# EAGLE design lab-genelec8010-input-board-v10 (EAGLE 9.6.2)
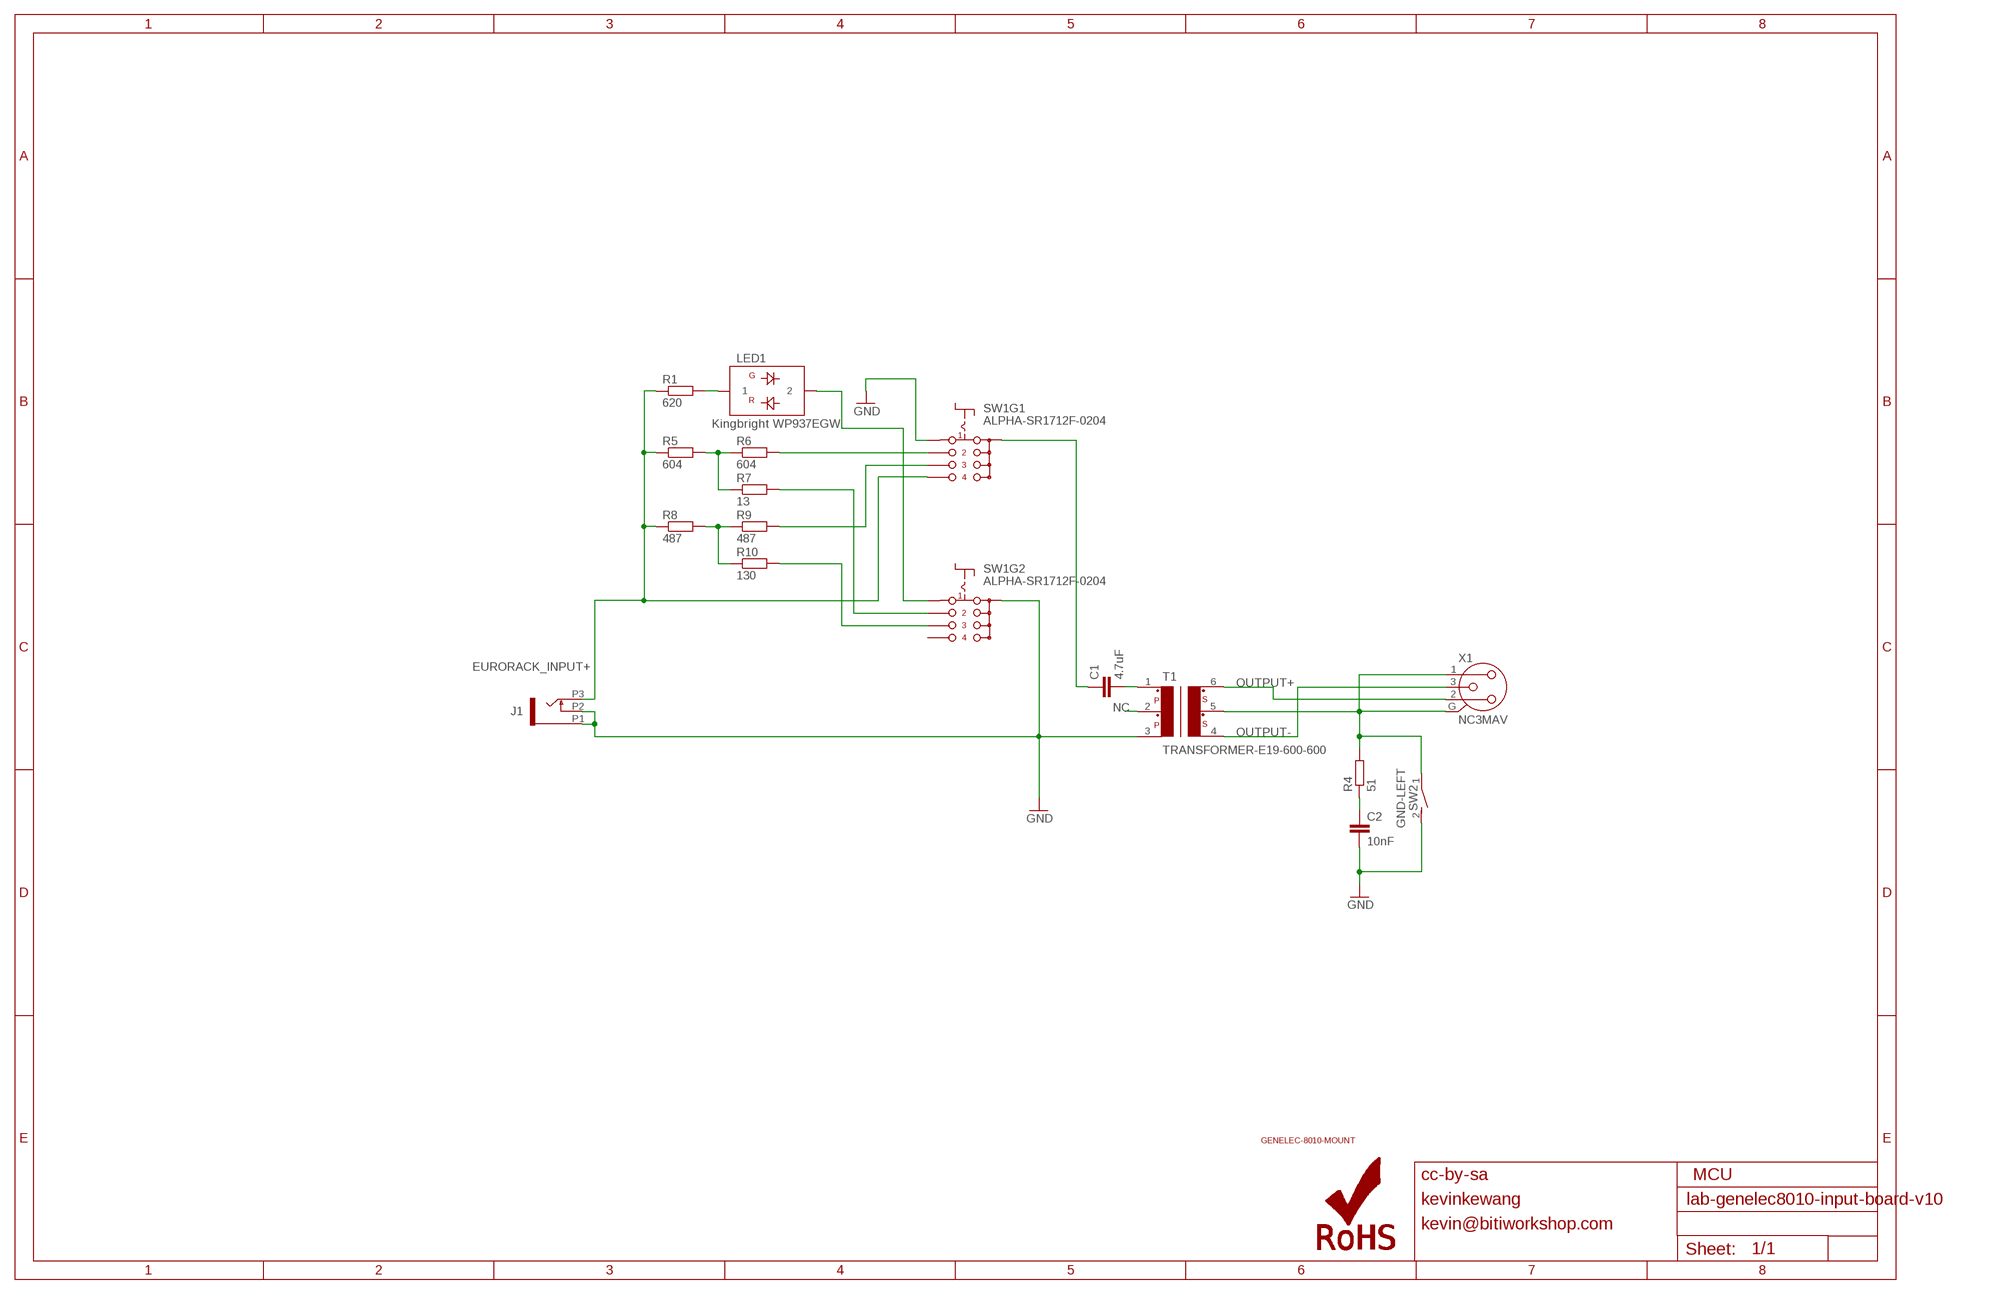
[diagram p0: schematic, sheet 1]

## Parts
C1  4.7uF  C15/5  [C15B5]
C2  10nF  C-EU025-025X050  [C025-025X050]
J1  OG-PJ301_PJ301_THONKICONN6  [OG-PJ301_WQP_PJ_301M6]
LED1  Kingbright WP937EGW  OG-LEDS_LED-BICOLOR-SHARED-THROUGHHOLE  [OG-LEDS_LED3MM]
LOGO2  ROHS_LOGO  [ROHS_LOGO_0.18_IN]
R1  620  R-EU_0204/2V  [0204V]
R4  51  R-EU_0204/2V  [0204V]
R5  604  R-EU_0204/2V  [0204V]
R6  604  R-EU_0204/2V  [0204V]
R7  13  R-EU_0204/2V  [0204V]
R8  487  R-EU_0204/2V  [0204V]
R9  487  R-EU_0204/2V  [0204V]
R10  130  R-EU_0204/2V  [0204V]
SW1  ALPHA-SR1712F-0204  [ALPHA-SR1712F-0204]
SW2  GND-LEFT  DS01E  [DS-01]
T1  TRANSFORMER-E19-600-600  [TRANSFORMER-E19-600-600]
U$2  GENELEC-8010-MOUNT  [GENELEC-8010-MOUNT]
X1  NC3MAV  [NC3MAV]

## Nets
EURORACK_INPUT+: J1.P3 R1.1 R5.1 R8.1 SW1.5
GND: C2.2 J1.P1 J1.P2 SW1.2 SW1.COM10(C) SW2.2 T1.3
N$1: LED1.2 SW1.6
N$2: LED1.1 R1.2
N$3: C1.2 T1.1
N$5: R5.2 R6.1 R7.1
N$6: C2.1 R4.1
N$7: R4.2 SW2.1 T1.5 X1.1 X1.G
N$9: R6.2 SW1.3
N$10: R7.2 SW1.7
N$11: R8.2 R9.1 R10.1
N$13: R9.2 SW1.4
N$14: R10.2 SW1.8
N$16: C1.1 SW1.COM1(C)
NC: T1.2
OUTPUT+: T1.6 X1.2
OUTPUT-: T1.4 X1.3
Unconnected: SW1.9

## Notes on the sheet
- cc-by-sa | MCU
- kevinkewang
- kevin@bitiworkshop.com

## Library data of the parts
C1 = capacitor-wima:C: CAPACITOR naming: grid - package width
C2 = rcl:C-EU: CAPACITOR, European symbol; SPICEPREFIX: C
J1 = tides2_v40:OG-PJ301_PJ301_THONKICONN
LED1 = tides2_v40:OG-LEDS_LED-BICOLOR-SHARED-THROUGHHOLE
LOGO2 = SparkFun-Aesthetics:ROHS_LOGO: Restriction of Hazardous Substances (RoHS) Logo Logo for RoHS-certified hardware.
R1 R4-R10 = rcl:R-EU_: RESISTOR, European symbol; SPICEPREFIX: R
SW1 = biti-switch:ALPHA-SR1712F-0204
SW2 = Switch:DS01E: DIL/CODE Switch; CATEGORY_L1: Switches; CATEGORY_L2: DIP Switches; CATEGORY_L3: SPST-NO; MANUFACTURER: Multicomp Pro; OPERATING_TEMPERATURE: -40°C ~ 85°C; PACKAGE: Through Hole; PACKAGE_SIZE: NA; PART_STATUS: Obsolete; ROHS: Compliant
T1 = biti-transformer:TRANSFORMER-E19-600-600: TRANSFORMER-E19-600-600
U$2 = biti-mount:GENELEC-8010-MOUNT
X1 = con-neutrik_ag:NC3: Neutrik Audio Connector XLR SERIES Stereo 1/4" jack Source: www.neutrik.com/; MF: FARNELL; MPN: NC3MAV; OC_FARNELL: 724531; OC_NEWARK: 46WX3058

## Board
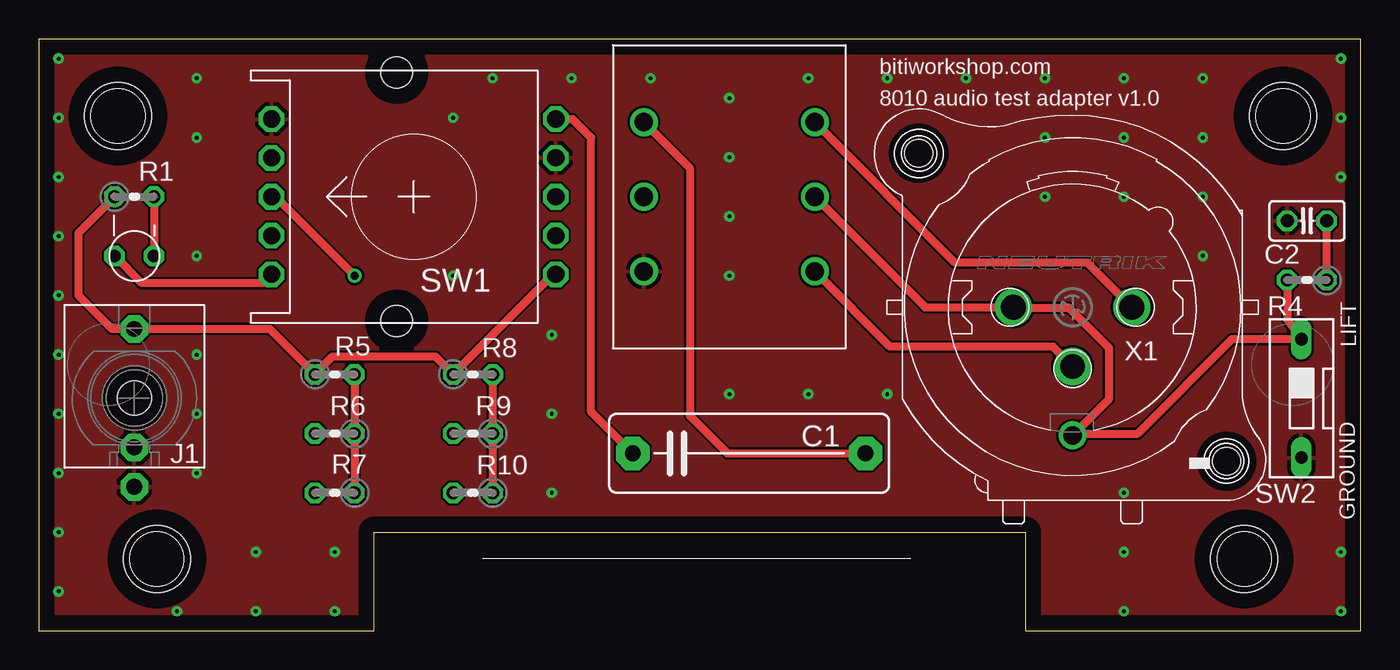
[diagram p1: board, top side]
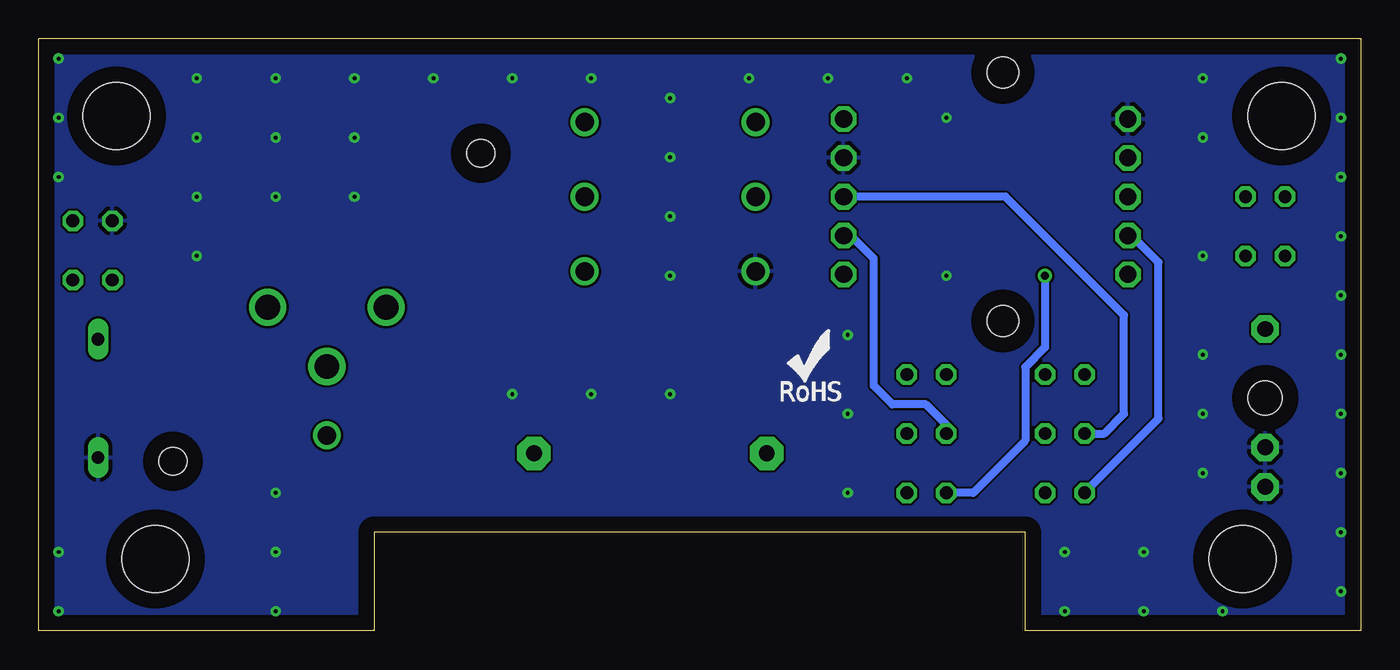
[diagram p2: board, bottom side, seen from below]

Size 85.09 x 38.1 mm. Coordinates in mm from the lower left corner, seen from the top.
Outline: 85.09,0 85.09,38.1 0,38.1 0,0 21.59,0 21.59,6.35 63.5,6.35 63.5,0 85.09,0
Copper layers (1*16): Top 0.035mm / dielectric 1.5mm / Bottom 0.035mm
Design rules "default *": minimum track width 6mil, minimum drill 0.35mm, track to track 6mil, track to pad 6mil, pad to pad 6mil, via to via 6mil, smd to smd 6mil, copper to edge 40mil, drill to drill 6mil, minimum pad ring 10mil, minimum via ring 8mil, stop-mask expansion 4mil, vias tented up to drill 20mil, thermal gap 10mil
Holes 1.78 mm at 56.64,30.73 76.45,10.92

### Footprints (pad centres in the part's own frame; a part is rotated, then mirrored left to right if it is on the bottom)
C15B5 = drill 1.016 pad 2.159 octagon: 1 -7.493,0; 2 7.493,0
C025-025X050 = drill 0.813 octagon: 1 -1.27,0; 2 1.27,0
OG-PJ301_WQP_PJ_301M6 = drill 1.016 pad 1.778 octagon: P1 0,-5.715; P2 0,-3.175; P3 0,4.445 | hole 2.2: 0,0
OG-LEDS_LED3MM = drill 0.813 octagon: 1 -1.27,0; 2 1.27,0
0204V = drill 0.813 octagon: 1 -1.27,0; 2 1.27,0
ALPHA-SR1712F-0204 = drill 1.1 octagon: 2 2.5,-9.15; 3 0,-9.15; 4 -2.5,-9.15; 5 -5,-9.15; 6 -5,9.15; 7 -2.5,9.15; 8 0,9.15; 9 2.5,9.15; COM1 5,-9.15; COM10 5,9.15 | hole 2: 8,1.1; -8,1.1
DS-01 = drill 0.813 long: 1 0,-3.81; 2 0,3.81
TRANSFORMER-E19-600-600 = drill 1.2: 1 4.8,5.5; 2 0,5.5; 3 -4.8,5.5; 4 -4.8,-5.5; 5 0,-5.5; 6 4.8,-5.5
GENELEC-8010-MOUNT = hole 4.3: -36.817,15.354; -34.317,-13.146; 35.683,-13.146; 38.183,15.354
NC3MAV = drill 1.6: 1 -3.81,0; 2 3.81,0; 3 0,-3.81 | drill 1.2: G 0,-8.25

### Placement (x,y rotation side)
C1  45.72,11.43 0 top
C2  81.64,26.39 180 top
J1  6.15,14.99 0 top
LED1  6.15,24.13 180 top
LOGO2  37.54,14.68 0 bottom
R1  6.15,27.94 0 top
R4  81.64,22.58 180 top
R5  19.05,16.51 0 top
R6  19.05,12.7 180 top
R7  19.05,8.89 180 top
R8  27.94,16.51 0 top
R9  27.94,12.7 180 top
R10  27.94,8.89 180 top
SW1  24.13,27.94 90 top
SW2  81.28,14.96 180 top
T1  44.45,27.94 90 top
U$2  41.91,17.78 0 top
X1  66.55,20.83 0 top

### Tracks (layer width: path | path; a pad name or v marks a point on that pad's centre or on a via)
EURORACK_INPUT+
  Top 0.508: R1.1 2.54,25.6 2.54,21.59 4.7,19.43 J1.P3 14.86,19.43 R5.1 17.78,16.55 18.89,17.65 25.53,17.65 R8.1 33.1,22.94 SW1.5
GND  (via drill 0.25)
  other vias: 1.27,36.83 1.27,33.02 1.27,29.21 1.27,25.4 1.27,21.59 1.27,17.78 1.27,13.97 1.27,10.16 1.27,6.35 1.27,2.54 10.16,10.16 10.16,13.97 10.16,17.78 10.16,24.13 10.16,31.75 10.16,35.56 13.97,5.08 19.05,5.08 8.89,1.27 13.97,1.27 19.05,1.27 26.67,22.86 26.67,33.02 29.21,35.56 34.29,35.56 33.02,19.05 33.02,13.97 33.02,8.89 39.37,35.56 44.45,22.86 44.45,26.67 44.45,30.48 44.45,34.29 49.53,35.56 54.61,35.56 59.69,35.56 64.77,27.94 64.77,31.75 64.77,35.56 69.85,27.94 69.85,31.75 69.85,35.56 74.93,24.13 74.93,27.94 74.93,31.75 74.93,35.56 83.82,29.21 83.82,33.02 83.82,36.83 83.82,1.27 83.82,5.08 69.85,1.27 69.85,5.08 69.85,8.89 49.53,15.24 44.45,15.24 54.61,15.24
  pour Top: 0,38.1 85.09,38.1 85.09,0 0,0
  pour Bottom: 0,38.1 85.09,38.1 85.09,0 0,0
N$1
  Top 0.508: LED1.2 6.63,22.38 14.42,22.38 SW1.6
N$2
  Top 0.508: R1.2 LED1.1
N$3
  Top 0.508: T1.1 41.91,29.78 41.91,13.84 44.32,11.43 C1.2
N$5
  Top 0.508: R5.2 R6.1 R7.1
N$6
  Top 0.508: R4.1 C2.1
N$7
  Top 0.508: T1.5 57.06,20.83 X1.1 62.76,20.8 66.31,20.8 68.89,18.22 68.89,14.92 66.67,12.7 | 66.67,12.7 70.74,12.7 76.81,18.77 SW2.1 80.37,20.04 R4.2 | X1.G 66.67,12.7
N$9
  Bottom 0.508: R6.2 16.51,12.7 15.24,13.97 15.24,20.32 22.86,27.94 SW1.3
N$10
  Bottom 0.508: SW1.7 14.72,25.44 13.01,23.73 13.01,13.66 R7.2
N$11
  Top 0.508: R8.2 R9.1 R10.1
N$13
  Bottom 0.508: R9.2 26.67,13.26 27.99,14.58 30.15,14.58 31.34,15.77 31.34,23.96 32.82,25.44 SW1.4
N$14  (via drill 0.51)
  Top 0.508: v20.32,22.86 15.24,27.94 SW1.8
  Bottom 0.508: v20.32,22.86 20.32,18.25 21.59,16.98 21.59,12.24 24.94,8.89 R10.2
N$16
  Top 0.508: C1.1 35.56,14.1 35.56,31.75 34.37,32.94 SW1.COM1
OUTPUT+
  Top 0.508: T1.6 58.99,23.7 67.48,23.7 X1.2
OUTPUT-
  Top 0.508: T1.4 54.8,18.29 65.28,18.29 X1.3

### Text on the board
tPlace: bitiworkshop.com | 8010 audio test adapter v1.0 | LIFT | GROUND